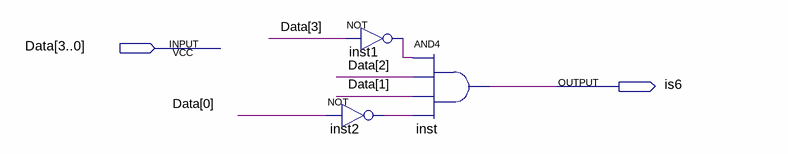
[diagram p0: schematic sheet]
// Quartus schematic check6.bdf as structural Verilog: 3 symbols, 2 pins
module check6 (
  input  [3:0] Data,
  output is6
);

  wire inst1_out, inst2_out;

  not inst1 (inst1_out, Data[3]);
  not inst2 (inst2_out, Data[0]);
  and inst (is6, inst1_out, Data[2], Data[1], inst2_out);
endmodule
